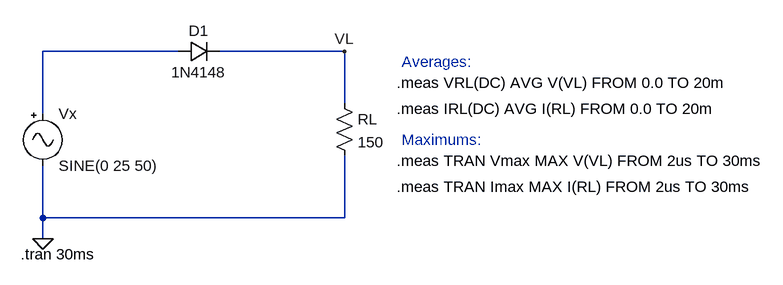
[diagram p0: schematic EXP1.1.asc]
EXP1.1.asc, the LTspice schematic file:
Version 4
SHEET 1 1136 680
WIRE 32 64 -176 64
WIRE 288 64 96 64
WIRE 288 144 288 64
WIRE -176 160 -176 64
WIRE -176 320 -176 240
WIRE 288 320 288 224
WIRE 288 320 -176 320
WIRE -176 352 -176 320
FLAG 288 64 VL
FLAG -176 352 0
SYMBOL Misc\\signal -176 144 R0
SYMATTR InstName Vx
SYMATTR Value SINE(0 25 50)
SYMBOL diode 32 80 R270
WINDOW 0 32 32 VTop 2
WINDOW 3 0 32 VBottom 2
SYMATTR InstName D1
SYMATTR Value 1N4148
SYMBOL res 272 128 R0
SYMATTR InstName RL
SYMATTR Value 150
TEXT 368 112 Left 2 !.meas VRL(DC) AVG V(VL) FROM 0.0 TO 20m
TEXT 368 152 Left 2 !.meas IRL(DC) AVG I(RL) FROM 0.0 TO 20m
TEXT -210 376 Left 2 !.tran 30ms
TEXT 368 232 Left 2 !.meas TRAN Vmax MAX V(VL) FROM 2us TO 30ms
TEXT 368 272 Left 2 !.meas TRAN Imax MAX I(RL) FROM 2us TO 30ms
TEXT 376 80 Left 2 ;Averages:
TEXT 376 200 Left 2 ;Maximums:

The netlist it stands for:
* EXP1.1.asc
Vx N001 0 SINE(0 25 50)
D1 N001 VL 1N4148
RL VL 0 150
.model D D
.lib standard.dio
.meas VRL(DC) AVG V(VL) FROM 0.0 TO 20m
.meas IRL(DC) AVG I(RL) FROM 0.0 TO 20m
.tran 30ms
.meas TRAN Vmax MAX V(VL) FROM 2us TO 30ms
.meas TRAN Imax MAX I(RL) FROM 2us TO 30ms
* Averages:
* Maximums:
.backanno
.end